# Altium schematic sheet ADC.SchDoc
size 297 x 209 mm
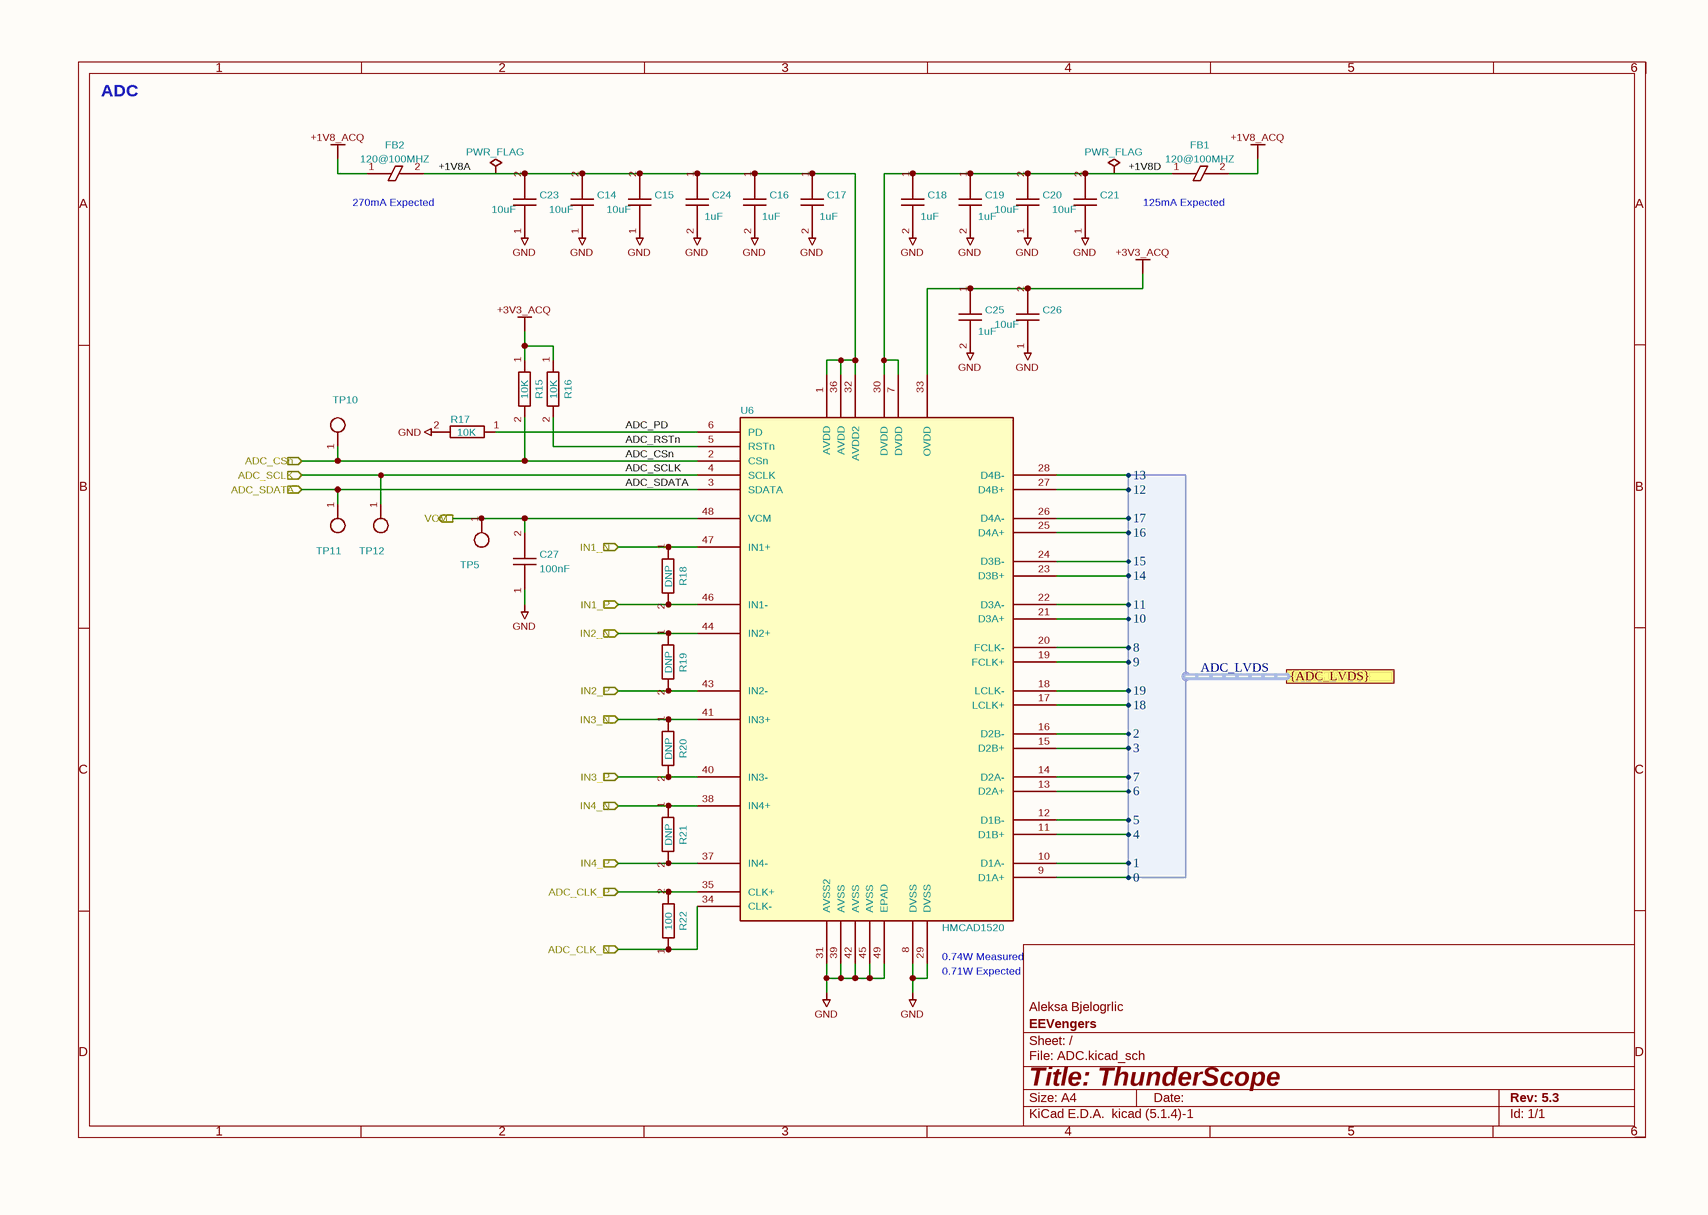
[diagram p0: ADC.SchDoc]

## Parts
#FLG07  PWR_FLAG  (graphical)
#FLG08  PWR_FLAG  (graphical)
C14  10uF  [GEN_C_0603]
C15  10uF  [GEN_C_0603]
C16  1uF  [GEN_C_0402]
C17  1uF  [GEN_C_0402]
C18  1uF  [GEN_C_0402]
C19  1uF  [GEN_C_0402]
C20  10uF  [GEN_C_0603]
C21  10uF  [GEN_C_0603]
C23  10uF  [GEN_C_0603]
C24  1uF  [GEN_C_0402]
C25  1uF  [GEN_C_0402]
C26  10uF  [GEN_C_0603]
C27  100nF  [GEN_C_0402]
FB1  120@100MHZ  [GEN_R_0402]
FB2  120@100MHZ  [GEN_R_0402]
R15  10K  [GEN_R_0402]
R16  10K  [GEN_R_0402]
R17  10K  [GEN_R_0402]
R18  DNP  [GEN_R_0402]
R19  DNP  [GEN_R_0402]
R20  DNP  [GEN_R_0402]
R21  DNP  [GEN_R_0402]
R22  100  [GEN_R_0402]
TP5  PCB  [GEN_TP_PCB]  (value not drawn)
TP10  PCB  [GEN_TP_PCB]  (value not drawn)
TP11  PCB  [GEN_TP_PCB]  (value not drawn)
TP12  PCB  [GEN_TP_PCB]  (value not drawn)
U6  HMCAD1520  [AD_QFN48_LP7]

## Ports
ADC_CLK_N (in), ADC_CLK_P (in), ADC_CSn (in), ADC_SCLK (in), ADC_SDATA (in), IN1_N (in), IN1_P (in), IN2_N (in), IN2_P (in), IN3_N (in), IN3_P (in), IN4_N (in), IN4_P (in), VCM (out), {ADC_LVDS} (harness ADC_LVDS)

## Harnesses
ADC_LVDS: 0, 1, 2, 3, 4, 5, 6, 7, 8, 9, 10, 11, 12, 13, 14, 15, 16, 17, 18, 19

## Nets
+1V8_ACQ: FB1.2 FB2.1
+3V3_ACQ: C25.1 C26.2 R15.1 R16.1 U6.33(OVDD)
GND: C14.1 C15.1 C16.2 C17.2 C18.2 C19.2 C20.1 C21.1 C23.1 C24.2 C25.2 C26.1 C27.1 R17.2 U6.8(DVSS) U6.29(DVSS) U6.31(AVSS2) U6.39(AVSS) U6.42(AVSS) U6.45(AVSS) U6.49(EPAD)
+1V8A: #FLG07.1 C14.2 C15.2 C16.1 C17.1 C23.2 C24.1 FB2.2 U6.1(AVDD) U6.32(AVDD2) U6.36(AVDD)
+1V8D: #FLG08.1 C18.1 C19.1 C20.2 C21.2 FB1.1 U6.7(DVDD) U6.30(DVDD)
ADC_CLK_N: R22.1 U6.34(CLK-) ; port ADC_CLK_N
ADC_CLK_P: R22.2 U6.35(CLK+) ; port ADC_CLK_P
ADC_CSn: R15.2 TP10.1 U6.2(CSn) ; port ADC_CSn
ADC_PD: R17.1 U6.6(PD)
ADC_RSTn: R16.2 U6.5(RSTn)
ADC_SCLK: TP12.1 U6.4(SCLK) ; port ADC_SCLK
ADC_SDATA: TP11.1 U6.3(SDATA) ; port ADC_SDATA
IN1_N: R18.1 U6.47(IN1+) ; port IN1_N
IN1_P: R18.2 U6.46(IN1-) ; port IN1_P
IN2_N: R19.1 U6.44(IN2+) ; port IN2_N
IN2_P: R19.2 U6.43(IN2-) ; port IN2_P
IN3_N: R20.1 U6.41(IN3+) ; port IN3_N
IN3_P: R20.2 U6.40(IN3-) ; port IN3_P
IN4_N: R21.1 U6.38(IN4+) ; port IN4_N
IN4_P: R21.2 U6.37(IN4-) ; port IN4_P
VCM: C27.2 TP5.1 U6.48(VCM) ; port VCM
NetU6_9: U6.9(D1A+) ; port {ADC_LVDS}.0
NetU6_10: U6.10(D1A-) ; port {ADC_LVDS}.1
NetU6_11: U6.11(D1B+) ; port {ADC_LVDS}.4
NetU6_12: U6.12(D1B-) ; port {ADC_LVDS}.5
NetU6_13: U6.13(D2A+) ; port {ADC_LVDS}.6
NetU6_14: U6.14(D2A-) ; port {ADC_LVDS}.7
NetU6_15: U6.15(D2B+) ; port {ADC_LVDS}.3
NetU6_16: U6.16(D2B-) ; port {ADC_LVDS}.2
NetU6_17: U6.17(LCLK+) ; port {ADC_LVDS}.18
NetU6_18: U6.18(LCLK-) ; port {ADC_LVDS}.19
NetU6_19: U6.19(FCLK+) ; port {ADC_LVDS}.9
NetU6_20: U6.20(FCLK-) ; port {ADC_LVDS}.8
NetU6_21: U6.21(D3A+) ; port {ADC_LVDS}.10
NetU6_22: U6.22(D3A-) ; port {ADC_LVDS}.11
NetU6_23: U6.23(D3B+) ; port {ADC_LVDS}.14
NetU6_24: U6.24(D3B-) ; port {ADC_LVDS}.15
NetU6_25: U6.25(D4A+) ; port {ADC_LVDS}.16
NetU6_26: U6.26(D4A-) ; port {ADC_LVDS}.17
NetU6_27: U6.27(D4B+) ; port {ADC_LVDS}.12
NetU6_28: U6.28(D4B-) ; port {ADC_LVDS}.13

## Notes on the sheet
- ADC
- (near FB2) 270mA Expected
- 125mA Expected
- (near U6) 0.74W Measured
- (near U6) 0.71W Expected
- 1
- 2
- 3
- 4
- 5
- 6
- A
- B
- C
- Aleksa Bjelogrlic
- D
- Title: ThunderScope
- File: ADC.kicad_sch
- Sheet: /
- EEVengers
- KiCad E.D.A.  kicad (5.1.4)-1
- Size: A4
- Date:
- Rev: 5.3
- Id: 1/1

## Library data of the parts
C14 C15 C20 C21 C23 C26 = CAP 10uF 25V X5R 0603: MANUFACTURER: Murata; MANUFACTURER PART NUMBER: GRM188R61E106MA73D; VOLTAGE RATING: 25V; Substitutions Policy: Any Parametric Equivalent; PACKAGE: 0402; SUPPLIER 1: Mouser; SUPPLIER PART NUMBER 1: 81-GRM188R61E106MA3D; Footprint: Thunderscope_Rev5:GEN_C_0603; Value: 10uF
C16-C19 C24 C25 = CAP 1uF 25V X5R 0402: MANUFACTURER: Murata; MANUFACTURER PART NUMBER: GRM155R61E105KA12D; VOLTAGE RATING: 25V; Substitutions Policy: Any Parametric Equivalent; PACKAGE: 0402; SUPPLIER 1: Mouser; SUPPLIER PART NUMBER 1: 81-GRM155R61E105KA2D; Footprint: Thunderscope_Rev5:GEN_C_0402; Value: 1uF
C27 = CAP 100nF 16V X7R 0402: HOUSE PART NUMBER: C-100nF-0402-002; MANUFACTURER: Murata; MANUFACTURER PART NUMBER: GCM155R71C104KA55D; VOLTAGE RATING: 16V; Substitutions Policy: Any Parametric Equivalent; PACKAGE: 0402; SUPPLIER 1: Mouser; SUPPLIER PART NUMBER 1: 81-GCM155R71C104KA5D; Footprint: Thunderscope_Rev5:GEN_C_0402; Value: 100nF
FB1 FB2 = FERRITE BEAD 120 OHM 0402: HOUSE PART NUMBER: BLM15PX121SN1D; MANUFACTURER: Murata; Substitutions Policy: No Substitutions; SUPPLIER 1: Mouser; SUPPLIER PART NUMBER 1: 81-BLM15PX121SN1D; MANUFACTURER PART NUMBER: BLM15PX121SN1D; PACKAGE: 0402; Footprint: Thunderscope_Rev5:GEN_R_0402; Value: 120@100MHZ
R15-R17 = RES 10K OHM 1% 1/16W 0402: MANUFACTURER: Yageo; MANUFACTURER PART NUMBER: RC0402FR-0710KL; TOLERANCE: 1%; Substitutions Policy: Any Parametric Equivalent; PACKAGE: 0402; SUPPLIER 1: Mouser; SUPPLIER PART NUMBER 1: 603-RC0402FR-0710KL; Footprint: Thunderscope_Rev5:GEN_R_0402; Value: 10K
R18-R21 = RES DNP 0402: TOLERANCE: 1%; PACKAGE: 0402; Footprint: Thunderscope_Rev5:GEN_R_0402; Value: DNP
R22 = RES 100 OHM 1% 1/10W 0402: MANUFACTURER: Yageo; MANUFACTURER PART NUMBER: RC0402FR-07100RL; TOLERANCE: 1%; Substitutions Policy: Any Parametric Equivalent; PACKAGE: 0402; SUPPLIER 1: Mouser; SUPPLIER PART NUMBER 1: 603-RC0402FR-07100RL; Footprint: Thunderscope_Rev5:GEN_R_0402; Value: 100
TP5 TP10-TP12 = TP PCB 1mm: Footprint: Thunderscope_Rev5:GEN_TP_PCB; Value: PCB
U6 = IC ADC HMCAD1520: MANUFACTURER: Analog Devices; Substitutions Policy: No Substitutions; SUPPLIER 1: Mouser; SUPPLIER PART NUMBER 1: 584-HMCAD1520; MANUFACTURER PART NUMBER: HMCAD1520; PACKAGE: 48-QFN (7x7mm); Footprint: Thunderscope_Rev5:AD_QFN48_LP7; Value: HMCAD1520
#FLG07 #FLG08 = PWR_FLAG: Value: PWR_FLAG